# Altium schematic sheet Pressure_sensor_AFE2.SchDoc: =DT_SCH_Title
size A4; Organization: Droid Technologies; SheetNumber: 14; SheetTotal: 22
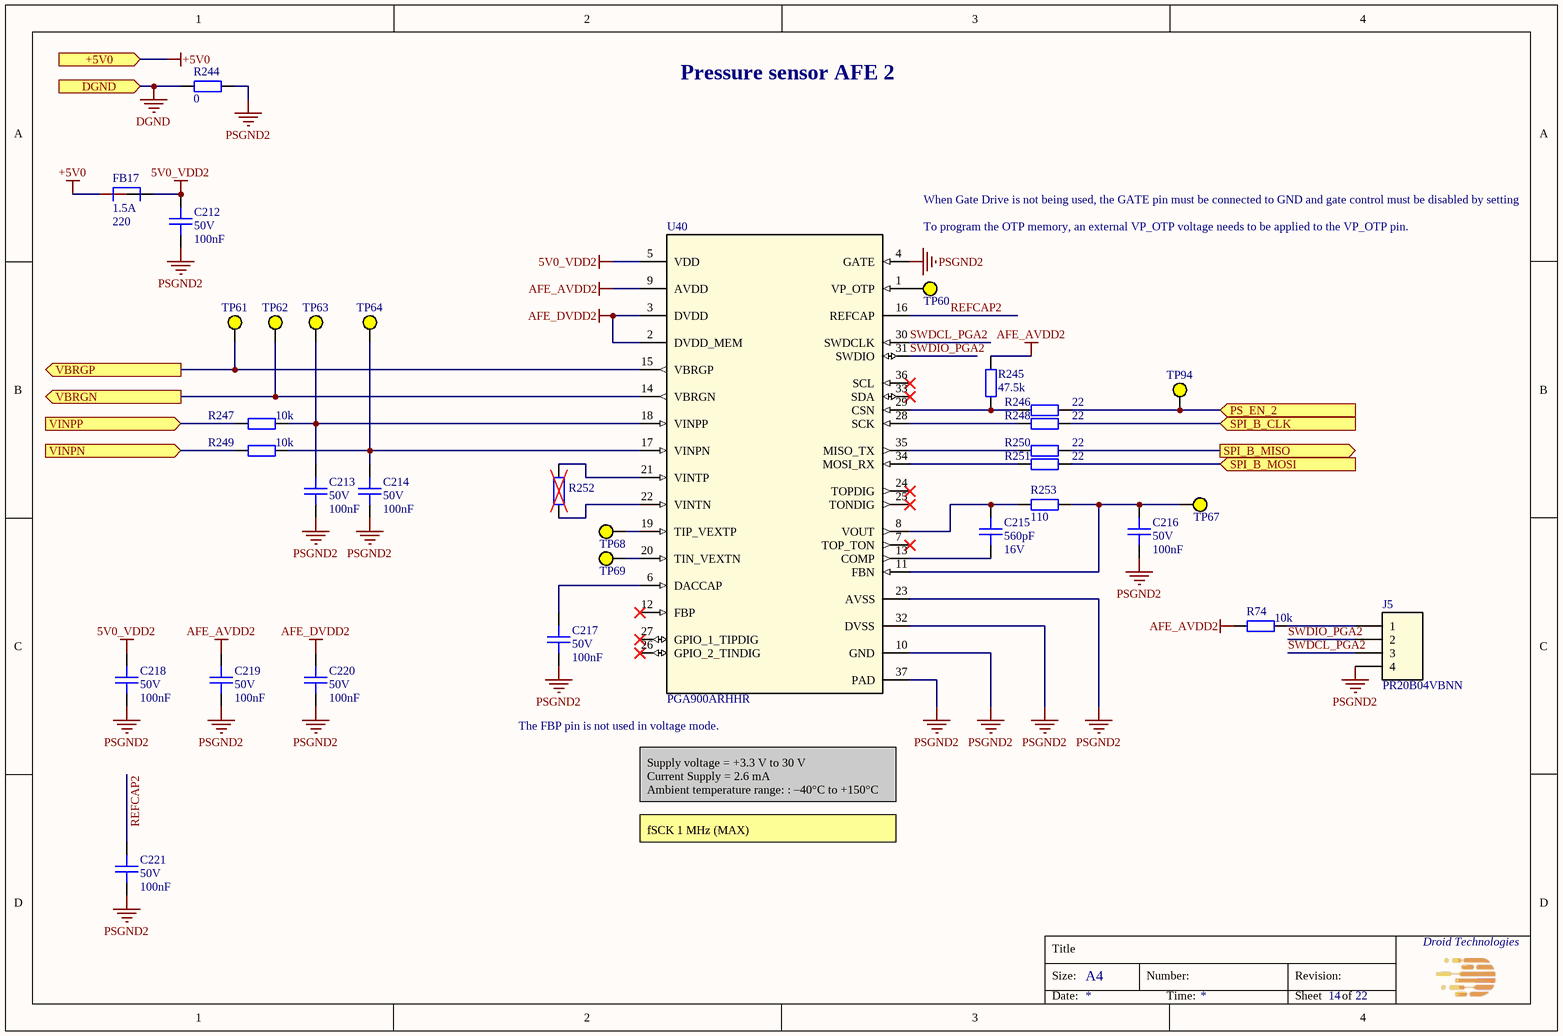
[diagram p0: Pressure_sensor_AFE2.SchDoc]

## Parts
C212  Voltage Rating: 50V  Capacitance: 100nF  [CAPC100x50x50L25]  (hidden comment: GCM155L8EH104KE07D)
C213  Voltage Rating: 50V  Capacitance: 100nF  [CAPC100x50x50L25]  (hidden comment: GCM155L8EH104KE07D)
C214  Voltage Rating: 50V  Capacitance: 100nF  [CAPC100x50x50L25]  (hidden comment: GCM155L8EH104KE07D)
C215  Capacitance: 560pF  Voltage Rating: 16V  [CAPC100x50x50L25]  (hidden comment: C0402C561F4HACAUTO)
C216  Voltage Rating: 50V  Capacitance: 100nF  [CAPC100x50x50L25]  (hidden comment: GCM155L8EH104KE07D)
C217  Voltage Rating: 50V  Capacitance: 100nF  [CAPC100x50x50L25]  (hidden comment: GCM155L8EH104KE07D)
C218  Voltage Rating: 50V  Capacitance: 100nF  [CAPC100x50x50L25]  (hidden comment: GCM155L8EH104KE07D)
C219  Voltage Rating: 50V  Capacitance: 100nF  [CAPC100x50x50L25]  (hidden comment: GCM155L8EH104KE07D)
C220  Voltage Rating: 50V  Capacitance: 100nF  [CAPC100x50x50L25]  (hidden comment: GCM155L8EH104KE07D)
C221  Voltage Rating: 50V  Capacitance: 100nF  [CAPC100x50x50L25]  (hidden comment: GCM155L8EH104KE07D)
FB17  Imax: 1.5A  Impedance: 220  [BEADC160X80X95L40]  (hidden comment: BLM18KG221BH1D)
J5  PR20B04VBNN  [M50-3530442]
R74  Resistance: 10k  [RESC100X50X40L25]  (hidden comment: RC0402FR-0710KL)
R244  Resistance: 0  [RESC160X80X55L30]  (hidden comment: RC0603FR-070RL)
R245  Resistance: 47.5k  [RESC100X50X40L25]  (hidden comment: RC0402FR-0747K5L)
R246  Resistance: 22  [RESC100X50X40L25]  (hidden comment: RC0402FR-0722RL)
R247  Resistance: 10k  [RESC100X50X40L25]  (hidden comment: RC0402FR-0710KL)
R248  Resistance: 22  [RESC100X50X40L25]  (hidden comment: RC0402FR-0722RL)
R249  Resistance: 10k  [RESC100X50X40L25]  (hidden comment: RC0402FR-0710KL)
R250  Resistance: 22  [RESC100X50X40L25]  (hidden comment: RC0402FR-0722RL)
R251  Resistance: 22  [RESC100X50X40L25]  (hidden comment: RC0402FR-0722RL)
R252  DNP chip res 0603  [RESC160X80X55L30]  (value not drawn)
R253  Resistance: 110  [RESC100X50X40L25]  (hidden comment: RC0402FR-07110RL)
TP60  Test Point  [TP_D1.5mm]  (value not drawn)  (no BOM)
TP61  Test Point  [TP_D0.75mm]  (value not drawn)  (no BOM)
TP62  Test Point  [TP_D0.75mm]  (value not drawn)  (no BOM)
TP63  Test Point  [TP_D0.75mm]  (value not drawn)  (no BOM)
TP64  Test Point  [TP_D0.75mm]  (value not drawn)  (no BOM)
TP67  Test Point  [TP_D0.75mm]  (value not drawn)  (no BOM)
TP68  Test Point  [TP_D1.5mm]  (value not drawn)  (no BOM)
TP69  Test Point  [TP_D1.5mm]  (value not drawn)  (no BOM)
TP94  Test Point  [TP_D0.75mm]  (value not drawn)  (no BOM)
U40  PGA900ARHHR  [36VQFN]

## Ports
+5V0 (in), DGND (in), PS_EN_2 (in), SPI_B_CLK (in), SPI_B_MISO (out), SPI_B_MOSI (in), VBRGN (out), VBRGP (out), VINPN (in), VINPP (in)

## Nets
5V0_VDD2: C212.2 C218.2 FB17.2 U40.5(VDD)
+5V0: FB17.1 ; port +5V0
AFE_AVDD2: C219.2 R74.2 R245.2 U40.9(AVDD)
AFE_DVDD2: C220.2 U40.2(DVDD_MEM) U40.3(DVDD)
DGND: R244.2 ; port DGND
PSGND2: C212.1 C213.1 C214.1 C216.1 C217.1 C218.1 C219.1 C220.1 C221.1 J5.4 R244.1 U40.4(GATE) U40.10(GND) U40.23(AVSS) U40.32(DVSS) U40.37(PAD)
PS_EN_2: R246.2 TP94.1 ; port PS_EN_2
REFCAP2: C221.2 U40.16(REFCAP)
SPI_B_CLK: R248.2 ; port SPI_B_CLK
SPI_B_MISO: R250.2 ; port SPI_B_MISO
SPI_B_MOSI: R251.2 ; port SPI_B_MOSI
SWDCL_PGA2: J5.3 U40.30(SWDCLK)
SWDIO_PGA2: J5.2 U40.31(SWDIO)
VBRGN: TP62.1 U40.14(VBRGN) ; port VBRGN
VBRGP: TP61.1 U40.15(VBRGP) ; port VBRGP
VINPN: R249.1 ; port VINPN
VINPP: R247.1 ; port VINPP
NetC213_2: C213.2 R247.2 TP63.1 U40.18(VINPP)
NetC214_2: C214.2 R249.2 TP64.1 U40.17(VINPN)
NetC215_1: C215.1 U40.13(COMP)
NetC215_2: C215.2 R253.1 U40.8(VOUT)
NetC216_2: C216.2 R253.2 TP67.1 U40.11(FBN)
NetC217_2: C217.2 U40.6(DACCAP)
NetJ5_1: J5.1 R74.1
NetR245_1: R245.1 R246.1 U40.29(CSN)
NetR248_1: R248.1 U40.28(SCK)
NetR250_1: R250.1 U40.35(MISO_TX)
NetR251_1: R251.1 U40.34(MOSI_RX)
NetR252_1: R252.1 U40.22(VINTN)
NetR252_2: R252.2 U40.21(VINTP)
NetTP60_1: TP60.1 U40.1(VP_OTP)
NetTP68_1: TP68.1 U40.19(TIP_VEXTP)
NetTP69_1: TP69.1 U40.20(TIN_VEXTN)

Not connected (* = marked no-connect by the designer): U40 7(TOP_TON)* 12(FBP)* 24(TOPDIG)* 25(TONDIG)* 26(GPIO_2_TINDIG)* 27(GPIO_1_TIPDIG)* 33(SDA)* 36(SCL)*

## Notes on the sheet
- Pressure sensor AFE 2
- To program the OTP memory, an external VP_OTP voltage needs to be applied to the VP_OTP pin.
- When Gate Drive is not being used, the GATE pin must be connected to GND and gate control must be disabled by setting
- (near U40) The FBP pin is not used in voltage mode.
- Supply voltage = +3.3 V to 30 V
  Current Supply = 2.6 mA
  Ambient temperature range: : –40°C to +150°C
- fSCK 1 MHz (MAX)
- Title
- Size:
- A4
- Number:
- Revision:
- Date:
- Time:
- Sheet
- of

## Library data of the parts
C212-C214 C216-C221 = CMP-001-1980-2: CAP CER 0.1UF 50V X8L 0402; Manufacturer: Murata Electronics; Op Temp max: 150°C; Op Temp min: -55°C; Tolerance: 10%; Height max: 550µm; ComponentLink3Description: Digikey; Mounting Type: SM; ComponentLink3URL: https://www.digikey.com/en/products/detail/murata-electronics/GCM155L8EH104KE07D/11618823; Package: 0402 (1005 Metric); Lead Spacing: 0mm; MPN: GCM155L8EH104KE07D; Size: 1.00mm x 0.50mm; Ratings: AEC-Q200; ComponentLink1URL: https://www.murata.com/en-us/products/productdetail?partno=GCM155L8EH104KE07%23; ComponentLink1Description: Datasheet; Dielectric: X8L; ComponentLink2Description: Mouser; ComponentLink2URL: https://eu.mouser.com/ProductDetail/Murata-Electronics/GCM155L8EH104KE07D?qs=1mbolxNpo8fQSHf0HYnZWw%3D%3D
C215 = CMP-001-2011-2: CAP CER 0402 560PF 16V ULTRA STA; Manufacturer: KEMET; Dielectric: X8R; Tolerance: 1%; Op Temp max: 150°C; Op Temp min: -55°C; Package: 0402 (1005 Metric); MPN: C0402C561F4HACAUTO; ComponentLink3Description: Digikey; Mounting Type: SM; Height max: 550µm; Lead Spacing: 0mm; ComponentLink1Description: Datasheet; ComponentLink3URL: https://www.digikey.com/en/products/detail/kemet/C0402C561F4HACAUTO/7955183?s=N4IgjCBcpgbFoDGUBmBDANgZwKYBoQB7KAbRAGYBOMAVgA4QBdAgBwBcoQBlNgJwEsAdgHMQAXwJgA7AhDJI6bPiKkQAFgBMGzfGYh2nHgJHiCGmhtnzFuAsUhltGyuQh6DkbnyGiJ4SnSUVqiYtioOIAAMTH4akWpB0HIhSnaqNLCRAAQsAGJMrByeAKqC-GwA8igAsjhoWACuvDimIAC0lknyfA3K9mQ0MbHpmSwoMUA; ComponentLink2URL: https://eu.mouser.com/ProductDetail/KEMET/C0402C561F4HACAUTO?qs=j%252B1pi9TdxUZljUlO6hXHJQ%3D%3D; ComponentLink2Description: Mouser; ComponentLink1URL: https://www.kemet.com/en/us/product/C0402C561F4HACAUTO.html; Ratings: AEC-Q200; Size: 1.00mm x 0.50mm
FB17 = CMP-001-1981-1: FERRITE BEAD 220 OHM 0603 1LN; Manufacturer: Murata Electronics; DCR: 50m; Op Temp min: -55°C; Frequency: 100MHz; Op Temp max: 150°C; Number of Lines: 1; Mounting Type: SM; Size: 1.60mm x 0.80mm; ComponentLink2URL: https://eu.mouser.com/ProductDetail/Murata-Electronics/BLM18KG221BH1D?qs=sJ5gq5MLFXpgEHYBdWUtkQ%3D%3D; ComponentLink1Description: Datasheet; ComponentLink1URL: https://www.murata.com/en-us/products/productdata/8798137286686/QNFA9129.pdf; Lead Spacing: 0mm; Ratings: AEC-Q200; ComponentLink3Description: Digikey; ComponentLink3URL: https://www.digikey.com/en/products/detail/murata-electronics/BLM18KG221BH1D/6156000; Height max: 950µm; Package: 0603 (1608 Metric); ComponentLink2Description: Mouser; MPN: BLM18KG221BH1D
J5 = M50-3530442: Connector Header Through Hole 4 position 0.050" (1.27mm); Manufacturer: METZ CONNECT USA Inc.; MPN: PR20B04VBNN; ComponentLink1Description: Datasheet; ComponentLink1URL: https://www.lcsc.com/datasheet/C3326047.pdf; ComponentLink2Description: DigiKey; ComponentLink2URL: https://www.digikey.com/en/products/detail/metz-connect-usa-inc/PR20B04VBNN/12342910
R74 R247 R249 = CMP-00010-6: RES 10K OHM 1% 1/16W 0402; Manufacturer: YAGEO; Op Temp max: 155°C; Op Temp min: -55°C; Power: 63mW; Temperature Coefficient: ±100ppm; ComponentLink3URL: https://www.digikey.com/en/products/detail/yageo/RC0402FR-0710KL/726523; ComponentLink1Description: Datasheet; Height max: 400µm; ComponentLink3Description: Digikey; ComponentLink2URL: https://www2.mouser.com/ProductDetail/YAGEO/RC0402FR-0710KL?qs=%2Fha2pyFaduhjtLcYvKXQ8NAGbRXkQ%2Fwl6RsvWHeV66MSeqLhkcF3rg%3D%3D; Ratings: -; MPN: RC0402FR-0710KL; ComponentLink1URL: https://www.yageo.com/upload/media/product/productsearch/datasheet/rchip/PYu-RC_Group_51_RoHS_L_12.pdf; ComponentLink2Description: Mouser; Mounting Type: SM; Tolerance: 1%; Composition: Thick Film; Size: 1.00mm x 0.50mm; Package: 0402 (1005 Metric)
R244 = CMP-001-0927-2: RES 0 OHM JUMPER 1/10W 0603; Manufacturer: YAGEO; Op Temp min: -55°C; Op Temp max: 155°C; Power: 100mW; Tolerance: 0%; Height max: 550µm; ComponentLink2URL: https://eu.mouser.com/ProductDetail/YAGEO/RC0603FR-070RL?qs=0yPvnVz5%2FmpDQv43TwvCfw%3D%3D; Temperature Coefficient: -; ComponentLink3Description: Digikey; ComponentLink2Description: Mouser; MPN: RC0603FR-070RL; ComponentLink1URL: https://www.yageo.com/upload/media/product/productsearch/datasheet/rchip/PYu-RC_Group_51_RoHS_L_12.pdf; Ratings: -; Size: 1.60mm x 0.80mm; Composition: Thick Film; Mounting Type: SM; ComponentLink3URL: https://www.digikey.com/en/products/detail/yageo/RC0603FR-070RL/1304008; Package: 0603 (1608 Metric); ComponentLink1Description: Datasheet
R245 = CMP-001-0277-7: RES 47.5K OHM 1% 1/16W 0402; Manufacturer: YAGEO; Op Temp min: -55°C; Power: 63mW; Temperature Coefficient: ±100ppm; Op Temp max: 155°C; ComponentLink1URL: https://www.yageo.com/upload/media/product/productsearch/datasheet/rchip/PYu-RC_Group_51_RoHS_L_12.pdf; ComponentLink1Description: Datasheet; MPN: RC0402FR-0747K5L; ComponentLink3Description: Digikey; ComponentLink2URL: https://eu.mouser.com/ProductDetail/YAGEO/RC0402FR-0747K5L?qs=V1yeUXFNrklfu86Rfgihxg%3D%3D; Mounting Type: SM; Tolerance: 1%; Package: 0402 (1005 Metric); Height max: 400µm; ComponentLink2Description: Mouser; ComponentLink3URL: https://www.digikey.com/en/products/detail/yageo/RC0402FR-0747K5L/726617; Size: 1.00mm x 0.50mm; Composition: Thick Film; Ratings: -
R246 R248 R250 R251 = CMP-001-0482-4: RES 22 OHM 1% 1/16W 0402; Manufacturer: YAGEO; Temperature Coefficient: ±100ppm; Op Temp max: 155°C; Op Temp min: -55°C; Power: 63mW; Ratings: -; ComponentLink3URL: https://www.digikey.com/en/products/detail/yageo/RC0402FR-0722RL/726562; ComponentLink2URL: https://eu.mouser.com/ProductDetail/YAGEO/RC0402FR-0722RL?qs=V1yeUXFNrkkRg6zf08ADKQ%3D%3D; MPN: RC0402FR-0722RL; ComponentLink1Description: Datasheet; ComponentLink3Description: Digikey; Tolerance: 1%; Size: 1.00mm x 0.50mm; ComponentLink1URL: https://www.yageo.com/upload/media/product/productsearch/datasheet/rchip/PYu-RC_Group_51_RoHS_L_12.pdf; Composition: Thick Film; ComponentLink2Description: Mouser; Mounting Type: SM; Package: 0402 (1005 Metric); Height max: 400µm
R252 = CMP-001-0920-3: DNP res 0603; Mounting Type: SM; MPN: DNP; Package: 0603 (1608 Metric)
R253 = CMP-001-0497-6: RES 110 OHM 1% 1/16W 0402; Manufacturer: YAGEO; Power: 63mW; Op Temp min: -55°C; Op Temp max: 155°C; Temperature Coefficient: ±100ppm; Size: 1.00mm x 0.50mm; ComponentLink1Description: Datasheet; Package: 0402 (1005 Metric); ComponentLink2URL: https://eu.mouser.com/ProductDetail/YAGEO/RC0402FR-07110RL?qs=QWYorlrD8IXj7iGvwWbRbA%3D%3D; MPN: RC0402FR-07110RL; ComponentLink3Description: Digikey; Height max: 400µm; Ratings: -; ComponentLink3URL: https://www.digikey.com/en/products/detail/yageo/RC0402FR-07110RL/2827583; Composition: Thick Film; ComponentLink2Description: Mouser; Tolerance: 1%; Mounting Type: SM; ComponentLink1URL: https://www.yageo.com/upload/media/product/productsearch/datasheet/rchip/PYu-RC_Group_51_RoHS_L_12.pdf
TP60 TP68 TP69 = TP_1.5
TP61-TP64 TP67 TP94 = TP_0.75: Test point 0.75mm
U40 = PGA900ARHHR: IC PROG SENSOR SGNL COND 36VQFN; Manufacturer: Texas Instruments; MPN: PGA900ARHHR